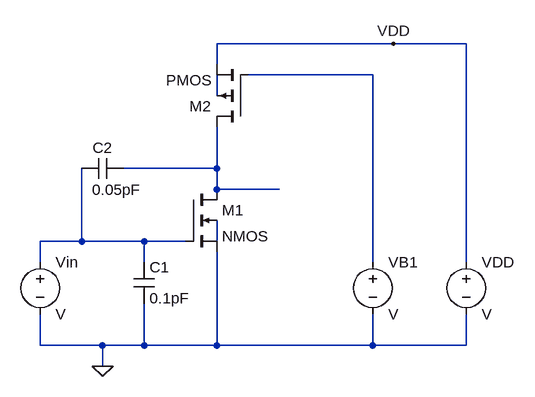
[diagram p0: schematic Exercise3-4-5.asc]
Exercise3-4-5.asc, the LTspice schematic file:
Version 4.1
SHEET 1 880 680
WIRE 480 -128 208 -128
WIRE 592 -128 480 -128
WIRE 208 -96 208 -128
WIRE 448 -80 256 -80
WIRE 208 -48 208 -80
WIRE 208 64 208 0
WIRE 208 64 64 64
WIRE 208 96 208 64
WIRE 304 96 208 96
WIRE 0 176 0 64
WIRE 0 176 -64 176
WIRE 96 176 0 176
WIRE 160 176 96 176
WIRE 208 176 208 144
WIRE -64 208 -64 176
WIRE 96 208 96 176
WIRE 448 208 448 -80
WIRE 592 208 592 -128
WIRE -64 336 -64 288
WIRE 32 336 -64 336
WIRE 96 336 96 272
WIRE 96 336 32 336
WIRE 208 336 208 192
WIRE 208 336 96 336
WIRE 448 336 448 288
WIRE 448 336 208 336
WIRE 592 336 592 288
WIRE 592 336 448 336
WIRE 32 368 32 336
FLAG 32 368 0
FLAG 480 -128 VDD
SYMBOL nmos4 160 96 R0
SYMATTR InstName M1
SYMBOL pmos4 256 0 R180
SYMATTR InstName M2
SYMBOL voltage -64 192 R0
SYMATTR InstName Vin
SYMBOL voltage 448 192 R0
SYMATTR InstName VB1
SYMBOL voltage 592 192 R0
SYMATTR InstName VDD
SYMBOL cap 64 48 R90
WINDOW 0 0 32 VBottom 2
WINDOW 3 33 10 VTop 2
SYMATTR InstName C2
SYMATTR Value 0.05pF
SYMBOL cap 80 208 R0
SYMATTR InstName C1
SYMATTR Value 0.1pF

The netlist it stands for:
* Exercise3-4-5.asc
M1 N003 N004 0 N005 NMOS
M2 N003 N001 VDD N002 PMOS
Vin N004 0 V
VB1 N001 0 V
VDD VDD 0 V
C2 N003 N004 0.05pF
C1 N004 0 0.1pF
.model NMOS NMOS
.model PMOS PMOS
.lib standard.mos
.backanno
.end